# EasyEDA Pro project 最小系统板.eprj

# Schematic Schematic1
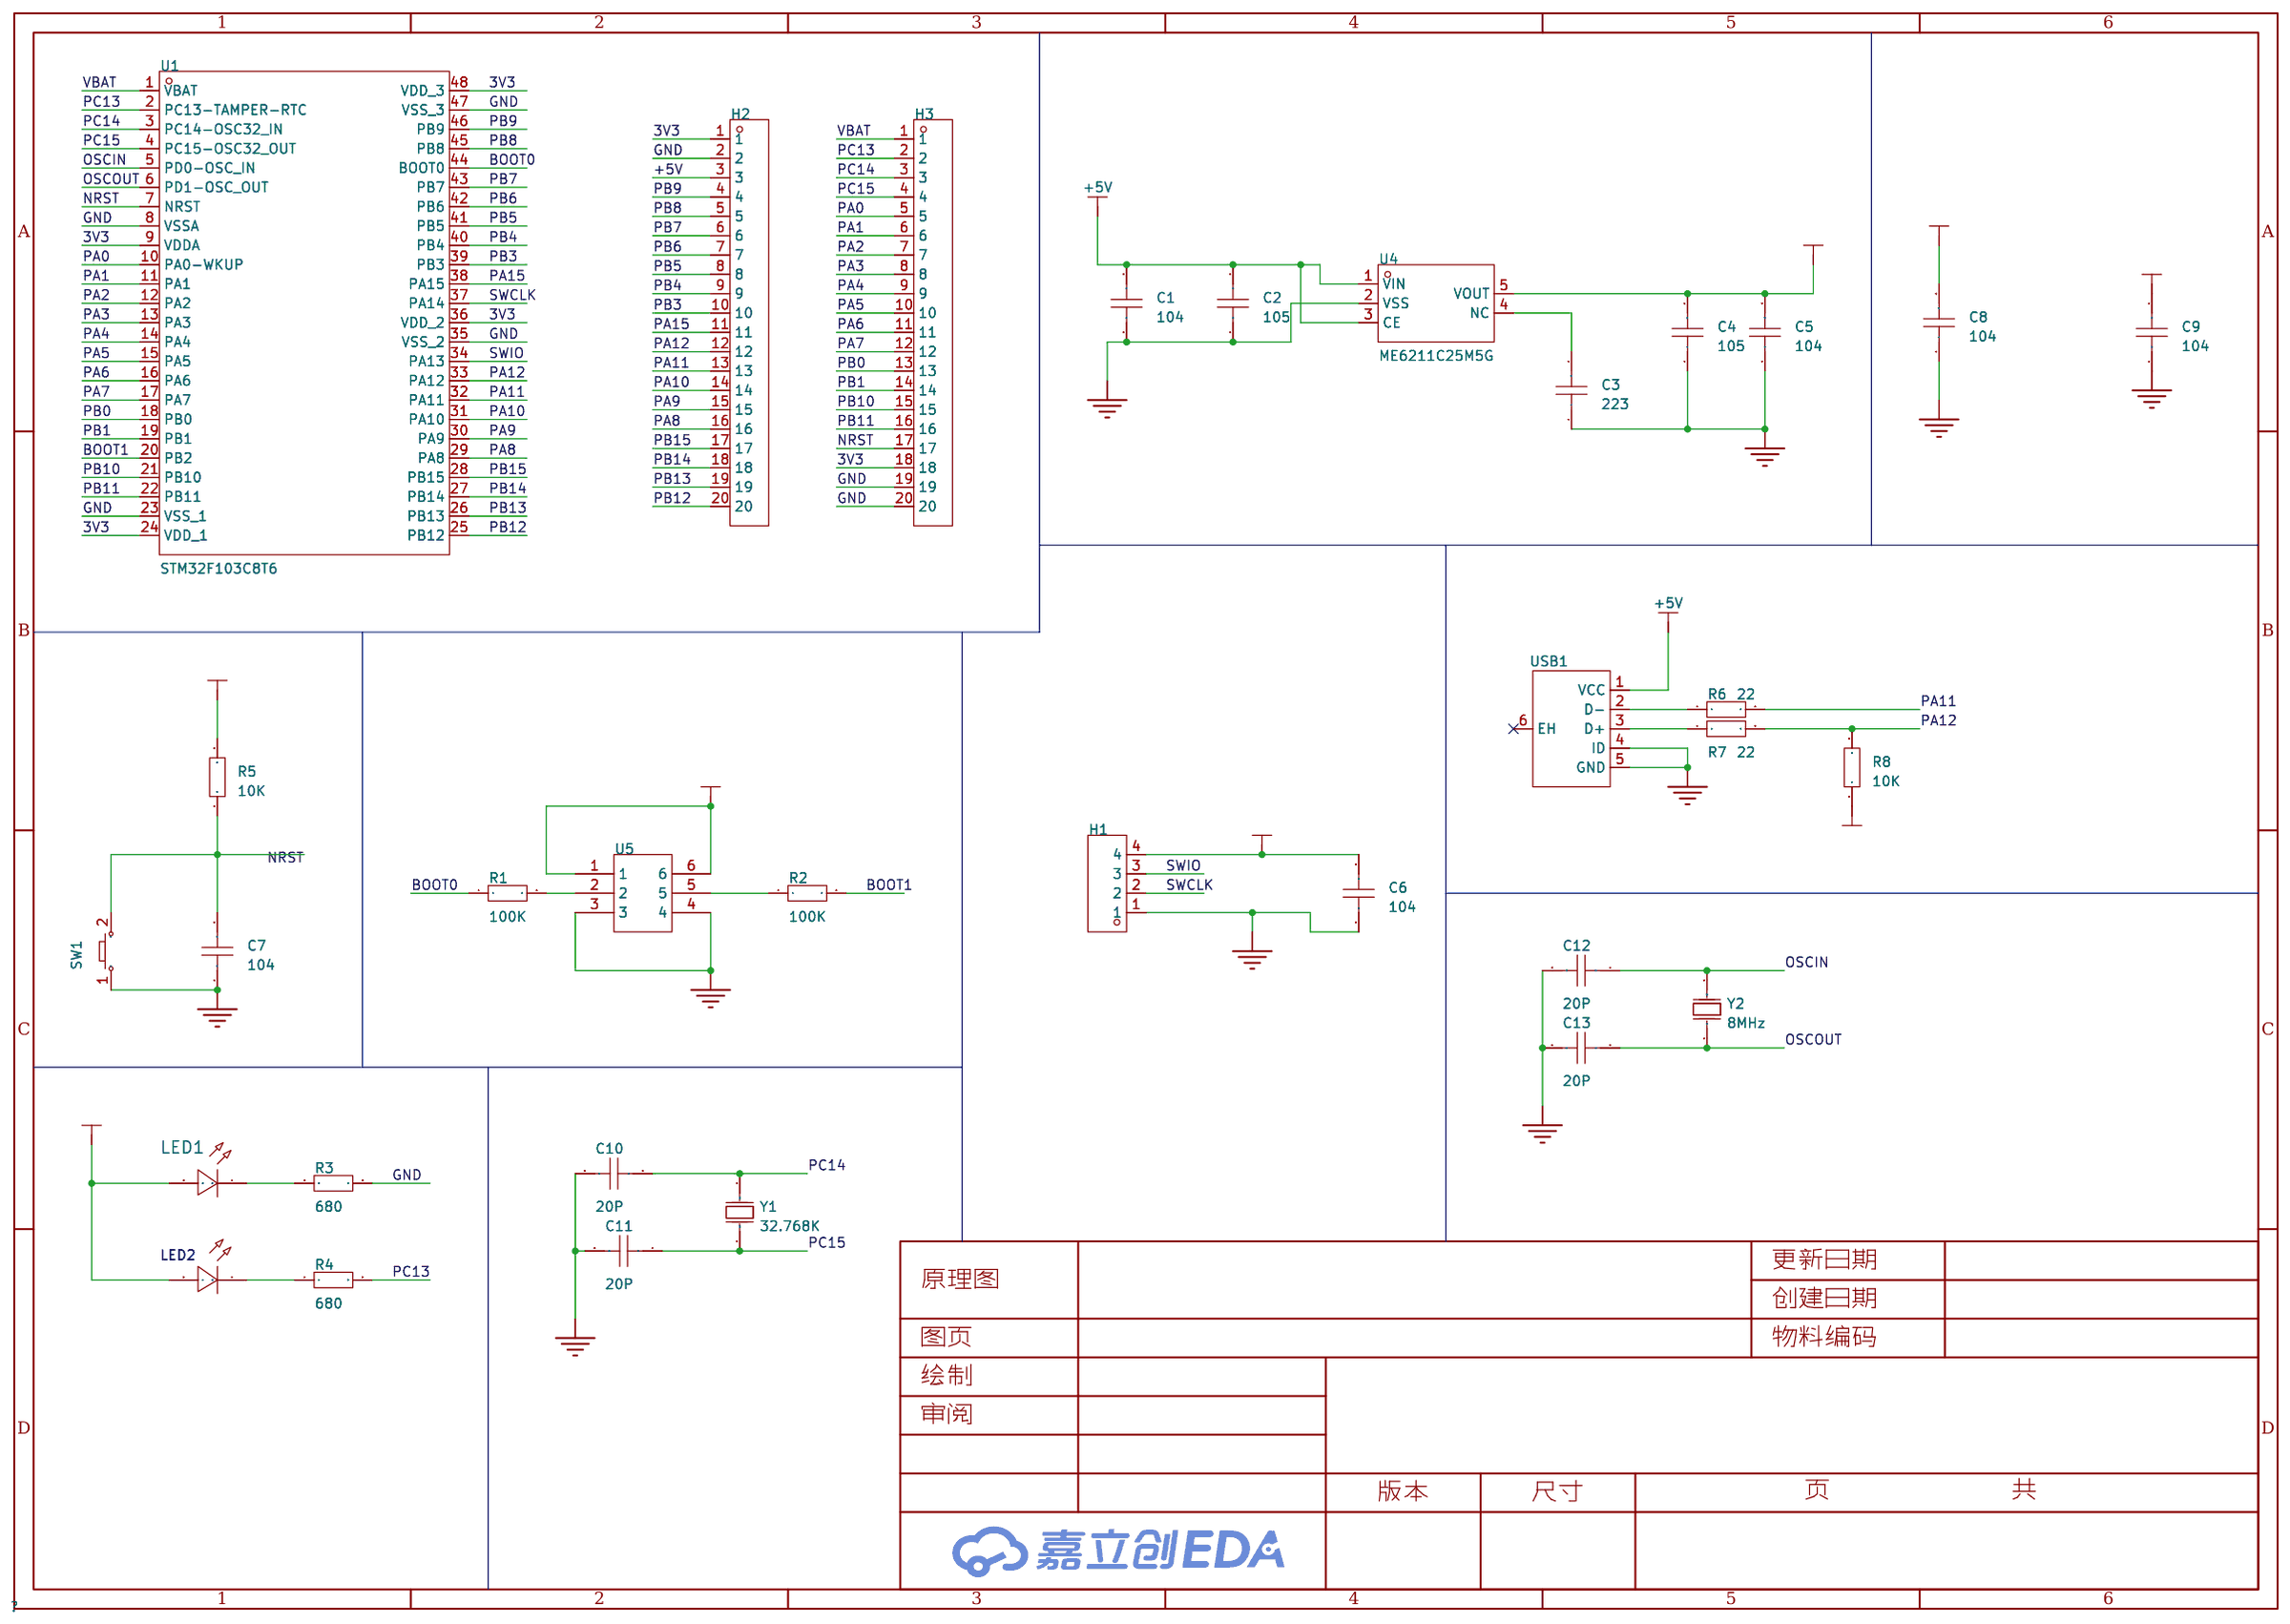
[diagram p0: schematic sheet]

## Parts
C1  104  [C0603]
C2  105  [C0603]
C3  223  [C0603]
C4  105  [C0603]
C5  104  [C0603]
C6  104  [C0603]
C7  104  [C0603]
C8  104  [C0603]
C9  104  [C0603]
C10  20P  [C0603]
C11  20P  [C0603]
C12  20P  [C0603]
C13  20P  [C0603]
H1  -  [HDR-TH_4P-P2.54-V-M]
H2  -  [HDR-TH_20P-P2.54-V-M-1]
H3  -  [HDR-TH_20P-P2.54-V-M-1]
LED1  -  [LED_0603]
LED2  -  [LED_0603]
R1  100K  [R0603]
R2  100K  [R0603]
R3  680  [R0603]
R4  680  [R0603]
R5  10K  [R0603]
R6  22  [R0603]
R7  22  [R0603]
R8  10K  [R0603]
SW1  -  [Key_SMD_3x4x2]
U1  STM32F103C8T6  [LQFP-48_L7.0-W7.0-P0.50-LS9.0-BL]
U4  ME6211C25M5G  [SOT-23-5_L2.9-W1.7-P0.95-LS2.8-BL]
U5  -  [排针2*3]
USB1  -  [USB_Micro]
Y1  32.768K  [OSC-SMD_L2.0-W1.2]
Y2  8MHz  [HC-49S_L11.4-W4.7-P4.88-D0.4]

## Library data of the parts
C1-C13 = CAP_0603: Supplier Footprint: 0603
H1 = HDR-M_2.54_1x4P: Supplier Part: C492403; Supplier Footprint: 插件
H2 H3 = HDR-M_2.54_1x20P: Supplier Part: C50981; Supplier Footprint: 插件
LED1 = LED_0603-R: Supplier Footprint: 0603
LED2 = LED_0603-B: Supplier Footprint: 0603
R1-R8 = Res_0603: Supplier Footprint: 0603
SW1 = Key_SMD_3x4x2: Supplier Footprint: SMD
U1 = STM32F103C8T6: LCSC Part Name: 主流增强型ARM Cortex-M3 MCU，具有64 KB Flash、72 MHz CPU、电机控制、USB和CAN; Supplier Part: C8734; Manufacturer: ST(意法半导体); Supplier Footprint: LQFP-48(7x7); JLCPCB Part Class: 扩展库; Datasheet: https://atta.szlcsc.com/upload/public/pdf/source/20220812/8363ACEC51AD55ECEB84799464F7CB85.pdf; Supplier: LCSC; CPU Core: ARM-M3; Program Storage Size: 64KB; RAM Size: 20KB; GPIO Ports Number: 37; Operating Voltage Range: 2V~3.6V; CPU Maximum Speed: 72MHz; Program Memory Type: FLASH; Operating Temperature Range: -40℃~+85℃; ADC (Bit): 12bit; Universal Serial Bus: 有; Peripheral/Function: 看门狗；DMA；看门狗；温度传感器; Watchdog: 有; Infrared Data Association: 有; Low-Voltage Detect: 有; Direct Memory Access: 有; Internal Oscillator: 有
U4 = ME6211C25M5G: LCSC Part Name: ME6211C25M5G 停产; Supplier Part: C2835813; Manufacturer: MICRONE(南京微盟); Supplier Footprint: SOT-23-5; JLCPCB Part Class: 扩展库; Datasheet: https://atta.szlcsc.com/upload/public/pdf/source/20211210/ACC7C3E9BA56F250BF966425916E32B9.pdf; Supplier: LCSC
U5 = 排针2*3
USB1 = USB_Micro-B: Supplier Footprint: SMD
Y1 = 32.768K: Supplier Part: C9900010122; Supplier Footprint: SMD2012-2P; JLCPCB Part Class: 扩展库; Supplier: LCSC
Y2 = ECS-080-20-4X-DU: LCSC Part Name: 8MHz ±30ppm 20pF; Supplier Part: C2636160; Manufacturer: ECS; Supplier Footprint: HC-49S; JLCPCB Part Class: 扩展库; Datasheet: https://atta.szlcsc.com/upload/public/pdf/source/20181031/C312311_8C746D9B0903A43D812CE762944D4B2E.pdf; Supplier: LCSC; Normal temperature Frequency Tolerance: ±30ppm; External load capacitor: 20pF; Frequency Stability(Full temperature range): ±100ppm; Equivalent Series Resistance (ESR): 80Ω; Operating Temperature: -55℃~+125℃

## Nets
3V3: C4.2 C5.2 C6.2 C8.2 C9.1 H1.4 H2.1 H3.18 LED1.2(A) LED2.2(A) R5.2 R8.1 U1.9(VDDA) U1.24(VDD_1) U1.36(VDD_2) U1.48(VDD_3) U4.5(VOUT) U5.1 U5.6
+5V: C1.2 C2.2 H2.3 U4.1(VIN) U4.3(CE) USB1.1(VCC)
GND: C1.1 C2.1 C3.1 C4.1 C5.1 C6.1 C7.1 C8.1 C9.2 C10.2 C11.2 C12.2 C13.2 H1.1 H2.2 H3.19 H3.20 R3.2 SW1.1 U1.8(VSSA) U1.23(VSS_1) U1.35(VSS_2) U1.47(VSS_3) U4.2(VSS) U5.3 U5.4 USB1.4(ID) USB1.5(GND)
VBAT: H3.1 U1.1(VBAT)
BOOT0: R1.1 U1.44(BOOT0)
BOOT1: R2.2 U1.20(PB2)
NRST: C7.2 H3.17 R5.1 SW1.2 U1.7(NRST)
OSCIN: C12.1 U1.5(PD0-OSC_IN) Y2.2
OSCOUT: C13.1 U1.6(PD1-OSC_OUT) Y2.1
PA0: H3.5 U1.10(PA0-WKUP)
PA1: H3.6 U1.11(PA1)
PA2: H3.7 U1.12(PA2)
PA3: H3.8 U1.13(PA3)
PA4: H3.9 U1.14(PA4)
PA5: H3.10 U1.15(PA5)
PA6: H3.11 U1.16(PA6)
PA7: H3.12 U1.17(PA7)
PA8: H2.16 U1.29(PA8)
PA9: H2.15 U1.30(PA9)
PA10: H2.14 U1.31(PA10)
PA11: H2.13 R6.2 U1.32(PA11)
PA12: H2.12 R7.2 R8.2 U1.33(PA12)
PA15: H2.11 U1.38(PA15)
PB0: H3.13 U1.18(PB0)
PB1: H3.14 U1.19(PB1)
PB3: H2.10 U1.39(PB3)
PB4: H2.9 U1.40(PB4)
PB5: H2.8 U1.41(PB5)
PB6: H2.7 U1.42(PB6)
PB7: H2.6 U1.43(PB7)
PB8: H2.5 U1.45(PB8)
PB9: H2.4 U1.46(PB9)
PB10: H3.15 U1.21(PB10)
PB11: H3.16 U1.22(PB11)
PB12: H2.20 U1.25(PB12)
PB13: H2.19 U1.26(PB13)
PB14: H2.18 U1.27(PB14)
PB15: H2.17 U1.28(PB15)
PC13: H3.2 R4.2 U1.2(PC13-TAMPER-RTC)
PC14: C10.1 H3.3 U1.3(PC14-OSC32_IN) Y1.2(OSC2)
PC15: C11.1 H3.4 U1.4(PC15-OSC32_OUT) Y1.1(OSC1)
SWCLK: H1.2 U1.37(PA14)
SWIO: H1.3 U1.34(PA13)
$1N8418: C3.2 U4.4(NC)
$1N9287: R1.2 U5.2
$1N9291: R2.1 U5.5
$1N9511: LED1.1(C) R3.1
$1N9515: LED2.1(C) R4.1
$1N10108: R6.1 USB1.2(D-)
$1N10112: R7.1 USB1.3(D+)

Not connected (* = marked no-connect by the designer): USB1 6(EH)*

# Board PCB3
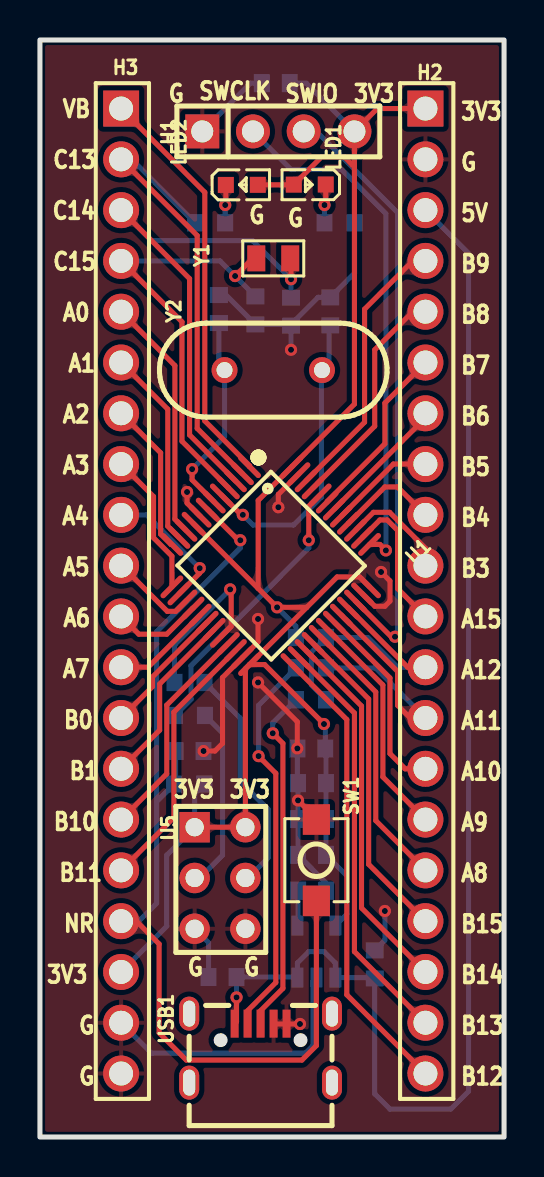
[diagram p1: board, top side]
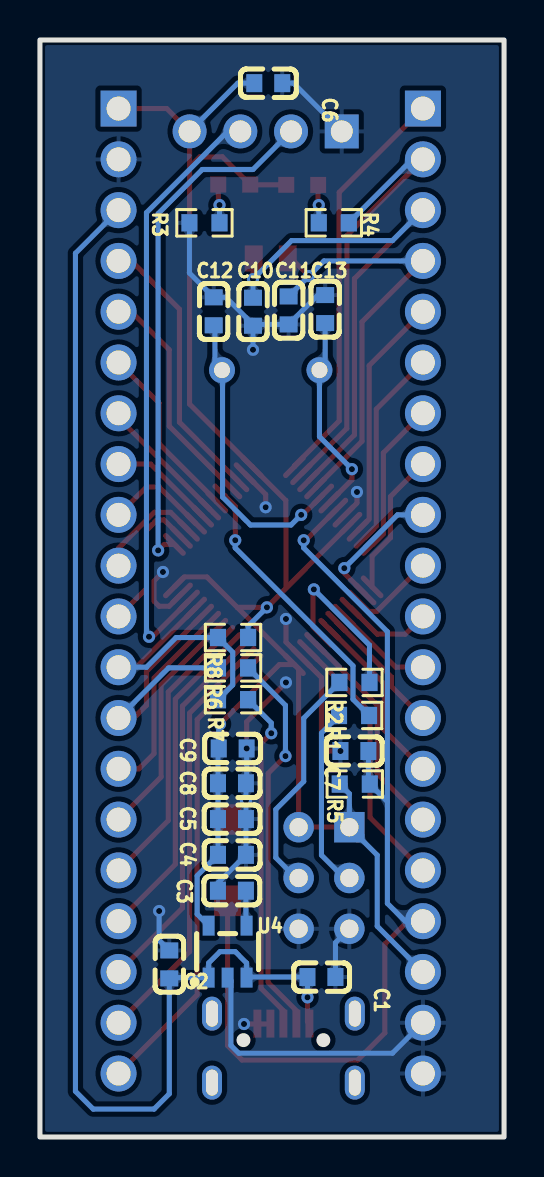
[diagram p2: board, bottom side, seen from below]

Outline 23.24 x 54.86 mm; copper layers: Top Layer, Bottom Layer. Coordinates in mm from the lower left corner of the outline.
Outline path: rectangle 0,54.86 23.24,0
Stack: Top Layer 0.035mm / Dielectric1 1.51mm FR4 er 4.5 / Bottom Layer 0.035mm

## Design rules (mm)
template: JLCPCB Capability(Two Layers Board)
spacing copperThickness1oz (default): track to track 0.102, other pairs 0.152 to 0.3
spacing copperThickness2oz: track to track 0.203, other pairs 0.152 to 0.3
track width copperThickness1oz (default): min 0.127, default 0.254, max 2.54
track width copperThickness2oz: min 0.203, default 0.254, max 2.54
differential pair differentialPair (default): width min 0.127, default 0.254, max 2.54; gap min 0.152, default 0.152
via viaSize (default): diameter min 0.5, default 0.61, max 10; hole min 0.3, default 0.305, max 6.3

## Placement (name value [footprint] x y rotation side)
C1  104  [C0603]  9.14 8 0 bottom
C2  105  [C0603]  16.76 8.63 270 bottom
C3  223  [C0603]  13.63 12.32 180 bottom
C4  105  [C0603]  13.62 14.11 0 bottom
C5  104  [C0603]  13.62 15.9 0 bottom
C6  104  [C0603]  11.81 52.71 0 bottom
C7  104  [C0603]  7.49 19.3 180 bottom
C8  104  [C0603]  13.62 17.69 0 bottom
C9  104  [C0603]  13.59 19.43 180 bottom
C10  20P  [C0603]  12.57 41.28 270 bottom
C11  20P  [C0603]  10.79 41.34 270 bottom
C12  20P  [C0603]  14.54 41.29 90 bottom
C13  20P  [C0603]  8.96 41.41 90 bottom
H1  -  [HDR-TH_4P-P2.54-V-M]  11.94 50.29 0 top
H2  -  [HDR-TH_20P-P2.54-V-M-1]  19.3 27.31 270 top
H3  -  [HDR-TH_20P-P2.54-V-M-1]  4.06 27.31 270 top
LED1  -  [LED_0603]  13.46 47.63 180 top
LED2  -  [LED_0603]  10.16 47.63 0 top
R1  100K  [R0603]  7.51 21.08 0 bottom
R2  100K  [R0603]  7.49 22.73 180 bottom
R3  680  [R0603]  15 45.72 0 bottom
R4  680  [R0603]  8.52 45.72 180 bottom
R5  10K  [R0603]  7.48 17.65 0 bottom
R6  22  [R0603]  13.57 23.46 0 bottom
R7  22  [R0603]  13.57 21.87 0 bottom
R8  10K  [R0603]  13.57 24.98 0 bottom
SW1  -  [Key_SMD_3x4x2]  13.84 13.84 270 top
U1  STM32F103C8T6  [LQFP-48_L7.0-W7.0-P0.50-LS9.0-BL]  11.56 28.58 225 top
U4  ME6211C25M5G  [SOT-23-5_L2.9-W1.7-P0.95-LS2.8-BL]  13.84 9.27 180 bottom
U5  -  [排针2*3]  -147.19 5.33 0 top
USB1  -  [USB_Micro]  11.05 4.45 0 top
Y1  32.768K  [OSC-SMD_L2.0-W1.2]  11.68 43.94 0 top
Y2  8MHz  [HC-49S_L11.4-W4.7-P4.88-D0.4]  11.68 38.35 0 top

## Footprints (pads in the part's own frame, mm; a bottom-side part is the same pattern mirrored in y, then rotated)
C0603
  rect 0.8x0.9 smd: 1(-0.7,0) 2(0.7,0)
HC-49S_L11.4-W4.7-P4.88-D0.4
  round 1.3 hole 0.8: 1(-2.44,0) 2(2.44,0)
HDR-TH_4P-P2.54-V-M
  rect 1.7x1.7 hole 1.1: 1(-3.81,0)
  round 1.7 hole 1.1: 2(-1.27,0) 3(1.27,0) 4(3.81,0)
HDR-TH_20P-P2.54-V-M-1
  rect 1.8x1.8 hole 1.2: 1(-24.13,0)
  round 1.8 hole 1.2: 2(-21.59,0) 3(-19.05,0) 4(-16.51,0) 5(-13.97,0) 6(-11.43,0) 7(-8.89,0) 8(-6.35,0) 9(-3.81,0) 10(-1.27,0) 11(1.27,0) 12(3.81,0) 13(6.35,0) 14(8.89,0) 15(11.43,0) 16(13.97,0) 17(16.51,0) 18(19.05,0) 19(21.59,0) 20(24.13,0)
Key_SMD_3x4x2
  rect 1.53x1.36 smd: 1(-2.035,0) 2(2.035,0)
LED_0603
  rect 0.8x0.8 smd: 1(-0.851,-0.01) 2(0.75,-0.005)
LQFP-48_L7.0-W7.0-P0.50-LS9.0-BL
  oval 0.27x1.5 smd: 1(-2.75,-4.25) 2(-2.25,-4.25) 3(-1.75,-4.25) 4(-1.25,-4.25) 5(-0.75,-4.25) 6(-0.25,-4.25) 7(0.25,-4.25) 8(0.75,-4.25) 9(1.25,-4.25) 10(1.75,-4.25) 11(2.25,-4.25) 12(2.75,-4.25) 25(2.75,4.25) 26(2.25,4.25) 27(1.75,4.25) 28(1.25,4.25) 29(0.75,4.25) 30(0.25,4.25) 31(-0.25,4.25) 32(-0.75,4.25) 33(-1.25,4.25) 34(-1.75,4.25) 35(-2.25,4.25) 36(-2.75,4.25)
  oval 1.5x0.27 smd: 13(4.25,-2.75) 14(4.25,-2.25) 15(4.25,-1.75) 16(4.25,-1.25) 17(4.25,-0.75) 18(4.25,-0.25) 19(4.25,0.25) 20(4.25,0.75) 21(4.25,1.25) 22(4.25,1.75) 23(4.25,2.25) 24(4.25,2.75) 37(-4.25,2.75) 38(-4.25,2.25) 39(-4.25,1.75) 40(-4.25,1.25) 41(-4.25,0.75) 42(-4.25,0.25) 43(-4.25,-0.25) 44(-4.25,-0.75) 45(-4.25,-1.25) 46(-4.25,-1.75) 47(-4.25,-2.25) 48(-4.25,-2.75)
OSC-SMD_L2.0-W1.2
  rect 0.9x1.3 smd: 1(-0.85,0) 2(0.85,0)
R0603
  rect 0.806x0.864 smd: 1(-0.753,0) 2(0.753,0)
SOT-23-5_L2.9-W1.7-P0.95-LS2.8-BL
  rect 0.6x1 smd: 1(-0.95,-1.3) 2(0,-1.3) 3(0.95,-1.3) 4(0.95,1.3) 5(-0.95,1.3)
USB_Micro
  rect 0.4x1.4 smd: 1(-1.3,1.225) 2(-0.65,1.225) 3(0,1.225) 4(0.65,1.225) 5(1.3,1.225)
  oval 1x1.7 hole 0.6x1.3: 6(-3.575,1.725) 6(-3.575,-1.725) 6(3.575,1.725) 6(3.575,-1.725)
排针2*3
  rect 1.524x1.524 hole 0.914: 1(154.94,10.16)
  round 1.524 hole 0.914: 2(154.94,7.62) 3(154.94,5.08) 4(157.48,5.08) 5(157.48,7.62) 6(157.48,10.16)

## Nets
As in the schematic.

Pads without a net: USB1 6

## Via types
v1: diameter 0.61, hole 0.305, Top Layer to Bottom Layer, 28 vias

## Routing (per net, layer and track width the routed paths; a pad name or vN(x,y) marks a point on that pad's centre or on a via; arc(x,y) is an arc through that point)
3V3: length 93.7
  Top Layer w0.254: 10.93,27.44 U1.9 ; 10.93,27.44 10.93,31.84 U1.48 15.75,36.66 15.75,48.61 ; 10.93,27.44 v1(11.88,26.49) 13.36,26.49 ; U1.24 10.29,23.42 10.29,15.49 7.75,15.49 ; U1.24 11.25,23.63 v1(14.22,20.65) ; U1.24 13.36,26.49 ; 15.75,48.61 H1.4 16.89,51.44 19.3,51.44 ; 15.75,48.61 15.65,48.61 15.24,49.02 14.1,49.02 LED1.2 12.7,47.62 LED2.2 ; 13.36,26.49 14.88,28.01 16.01,28.01 U1.36
  Bottom Layer w0.254: v1(14.22,20.65) 14.29,20.59 C9.1 14.32,19.4 C8.2 C5.2 C4.2 15.37,13.07 15.37,11.15 U4.5 ; H1.4 13.34,52.71 C6.2 ; R8.1 12.82,25.55 v1(11.88,26.49) ; H3.18 6.35,10.54 6.35,14.1 7.75,15.49 7.75,17.17 R5.2
+5V: length 67.4
  Top Layer w0.254: v1(9.84,6.99) 9.84,5.77 USB1.1
  Bottom Layer w0.254: 19.3,46.36 21.46,44.2 21.46,2.29 20.57,1.4 17.53,1.4 16.76,2.16 C2.2 16.73,7.97 U4.1 14.79,8.7 14.22,9.27 13.46,9.27 12.89,8.7 U4.3 12.86,8 C1.2 v1(9.84,6.99)
GND: length 64.5
  Top Layer w0.254: v1(13.02,5.65) 12.37,5.65 ; 12.37,5.65 12.35,5.67 ; 12.37,5.65 11.72,5.65 USB1.4 ; U1.47 11.94,32.14 v1(11.94,31.5) ; SW1.1 13.84,15.92 v1(12.92,16.83) ; v1(7.37,32.26) 7.37,31.71 U1.8 ; v1(8.19,19.3) 8.76,19.3 9.14,19.69 9.14,22.98 10.92,24.76 v1(10.92,25.91) ; v1(17.08,28.26) 17.53,27.81 17.53,26.8 17.27,26.54 16.77,26.54 16.15,27.16 ; v1(10.92,22.73) 12.89,20.77 v1(12.89,19.43)
  Bottom Layer w0.254: H1.1 10.54,52.71 C6.1 ; C10.2 v1(12.57,39.37) ; C10.2 12.51,40.64 C11.2 9.32,42.11 C13.2 ; C10.2 12.57,40.64 13.93,41.99 C12.2 15.76,43.21 R3.2 ; C1.1 8.44,9.72 7.75,10.41 ; U4.2 13.68,7.81 13.68,4.58 13.28,4.19 5.59,4.19 H3.19 ; C3.1 14.33,12.71 C4.1 C5.1 v1(12.92,16.83) C8.1 12.89,17.73 v1(12.89,19.43) ; C2.1 17.27,9.84 v1(17.27,11.3)
VBAT: length 20.6
  Top Layer w0.254: 4.06,51.44 8.25,47.24 8.25,35.81 10.5,33.57 U1.1
BOOT0: length 14
  Top Layer w0.254: v1(13.46,29.85) 13.46,31.54 U1.44
  Bottom Layer w0.254: v1(13.46,29.85) 13.46,29.46 7.56,23.57 7.56,21.89 R1.1
BOOT1: length 8.4
  Top Layer w0.254: U1.20 9.58,25.53 9.58,27.34 v1(9.53,27.39)
  Bottom Layer w0.254: v1(9.53,27.39) 6.74,24.6 R2.2
NRST: length 50.1
  Top Layer w0.254: 4.06,10.8 4.83,10.8 5.97,9.65 5.97,5.21 7.33,3.85 13.12,3.85 13.84,4.57 SW1.2 ; U1.7 9.93,29.85 v1(10.03,29.85)
  Bottom Layer w0.254: 5.84,16.77 5.84,25.27 10.03,29.46 v1(10.03,29.85) ; 5.84,16.77 R5.1 6.79,17.72 C7.2 ; 5.84,16.77 5.84,11.68 4.95,10.8 4.06,10.8
OSCIN: length 15
  Top Layer w0.254: U1.5 10.08,31.12 v1(10.16,31.12)
  Bottom Layer w0.254: v1(10.16,31.12) 10.67,30.61 12.7,30.61 14.1,32 14.1,38.33 Y2.2 14.48,38.71 14.48,40.53 C12.1
OSCOUT: length 10.2
  Top Layer w0.254: v1(7.62,33.4) 7.62,32.87 U1.6
  Bottom Layer w0.254: v1(7.62,33.4) 9.24,35.03 Y2.1 8.96,38.64 C13.1
PA0: length 12.3
  Top Layer w0.254: 4.06,41.28 6.76,38.58 6.76,30.9 U1.10
PA1: length 9.9
  Top Layer w0.254: H3.6 6.4,36.4 6.4,30.55 6.96,29.99
PA2: length 7.6
  Top Layer w0.254: H3.7 6.04,34.22 6.04,30.15 6.56,29.64 U1.12
PA3: length 7.2
  Top Layer w0.254: 4.06,33.66 5.69,32.03 5.69,29.97 6.61,29.05 U1.13
PA4: length 6.8
  Top Layer w0.254: v1(8,28.45) 8,28.2 U1.14
  Bottom Layer w0.254: H3.9 5.33,31.12 v1(8,28.45)
PA5: length 4.4
  Top Layer w0.254: U1.15 6.8,26.29 6.38,26.29 4.09,28.58 4.06,28.58
PA6: length 4.5
  Top Layer w0.254: U1.16 7.66,26.45 6.35,25.15 4.95,25.15 H3.11
PA7: length 5
  Top Layer w0.254: U1.17 5.42,23.5 4.06,23.5
PA8: length 13.9
  Top Layer w0.254: U1.29 16.82,22.26 16.82,15.82 H2.16
PA9: length 11.6
  Top Layer w0.254: 19.3,15.88 17.17,18.01 17.17,22.61 14.39,25.39
PA10: length 9.8
  Top Layer w0.254: 14.74,25.75 17.53,22.96 17.53,19.18 18.29,18.42 H2.14
PA11: length 13.4
  Top Layer w0.254: H2.13 18.54,20.96 17.91,21.59 17.91,23.29 U1.32
  Bottom Layer w0.254: H2.13 16.8,23.46 14.32,23.46
PA12: length 14.4
  Top Layer w0.254: U1.33 15.46,26.45 18.41,23.5 19.3,23.5
  Bottom Layer w0.254: 14.32,21.87 13.59,22.61 13.59,24.25 14.32,24.98 16.42,24.98 17.91,23.5 19.3,23.5
PA15: length 7.2
  Top Layer w0.254: H2.11 17.91,27.43 17.91,30.34 17.39,30.86 17.03,30.86 16.15,29.99
PB0: length 6.6
  Top Layer w0.254: U1.18 5.64,23.01 5.64,22.53 H3.13
PB1: length 8.9
  Top Layer w0.254: 8.73,25.39 5.99,22.66 5.99,20.35 H3.14
PB3: length 5.5
  Top Layer w0.254: U1.39 16.7,31.24 17.51,31.24 19.3,29.45 19.3,28.58
PB4: length 5.2
  Top Layer w0.254: U1.40 15.46,30.7 17.27,32.51 17.91,32.51 H2.9
PB5: length 5.3
  Top Layer w0.254: U1.41 17.7,33.66 19.3,33.66
PB6: length 6.7
  Top Layer w0.254: 14.74,31.4 19.3,35.97 H2.7
PB7: length 9
  Top Layer w0.254: U1.43 14.39,31.78 17.27,34.67 17.27,36.7 H2.6
PB8: length 11.5
  Top Layer w0.254: 19.3,41.28 18.67,41.28 16.76,39.37 16.76,35.55 U1.45
PB9: length 13.8
  Top Layer w0.254: U1.46 16.26,35.75 16.26,41.4 18.67,43.82 H2.4
PB10: length 11
  Top Layer w0.254: U1.21 6.35,21.6 6.35,18.16 4.06,15.88
PB11: length 13.4
  Top Layer w0.254: U1.22 6.71,21.25 6.71,15.98 H3.16
PB12: length 23.2
  Top Layer w0.254: H2.20 15.37,7.11 15.37,20.88 U1.25
PB13: length 20.9
  Top Layer w0.254: 12.97,23.98 15.75,21.2 15.75,9.27 H2.19
PB14: length 18.6
  Top Layer w0.254: H2.18 16.1,11.46 16.1,21.55 U1.27
PB15: length 16.2
  Top Layer w0.254: 19.3,10.8 16.46,13.64 16.46,21.9 U1.28
PC13: length 23.3
  Top Layer w0.254: H3.2 7.87,45.09 7.87,35.44 10.14,33.17
  Bottom Layer w0.254: R4.2 4.6,48.9 H3.2
PC14: length 27.7
  Top Layer w0.254: 4.06,46.36 7.49,42.93 7.49,35.11 U1.3 ; 12.57,42.93 12.57,43.9 Y1.2
  Bottom Layer w0.254: v1(12.57,42.9) 10.64,44.83 5.59,44.83 4.06,46.36 ; C10.1 12.57,42.8
PC15: length 22.5
  Top Layer w0.254: H3.4 7.11,40.77 7.11,34.8 9.44,32.47 U1.4 ; v1(9.77,43.06) 10.66,43.94 Y1.1
  Bottom Layer w0.254: C11.1 10.79,42.04 v1(9.77,43.06) 9.02,43.82 H3.4
SWCLK: length 26.1
  Top Layer w0.254: U1.37 17.02,29.64 v1(17.32,29.34)
  Bottom Layer w0.254: H1.2 12.57,48.39 15.11,48.39 17.32,46.18 v1(17.32,29.34)
SWIO: length 30.4
  Top Layer w0.254: v1(17.78,25.02) 17.59,25.02 U1.34
  Bottom Layer w0.254: H1.3 13.84,50.29 17.91,46.23 17.91,25.15 v1(17.78,25.02)
$1N8418: length 1.8
  Bottom Layer w0.254: C3.2 12.93,10.61 U4.4
$1N9287: length 9.2
  Bottom Layer w0.254: R1.2 9.14,20.2 9.14,14.1 8,12.95 7.75,12.95
$1N9291: length 11.6
  Bottom Layer w0.254: R2.1 10.03,20.95 10.03,17.78 11.43,16.38 11.43,13.97 10.41,12.95 10.29,12.95
$1N9511: length 1.9
  Top Layer w0.254: LED1.1 14.31,46.67 v1(14.25,46.61)
  Bottom Layer w0.254: R3.1 v1(14.25,46.61)
$1N9515: length 1.9
  Top Layer w0.254: v1(9.28,46.61) 9.31,46.64 LED2.1
  Bottom Layer w0.254: R4.1 v1(9.28,46.61)
$1N10108: length 19.5
  Top Layer w0.254: v1(10.95,19.05) 11.81,18.19 11.81,7.73 10.4,6.31 USB1.2
  Bottom Layer w0.254: R6.1 10.95,21.59 v1(10.95,19.05)
$1N10112: length 17.4
  Top Layer w0.254: v1(11.66,20.19) 12.17,19.68 12.17,7.43 11.05,6.31 USB1.3
  Bottom Layer w0.254: v1(11.66,20.19) 11.66,20.71 R7.1

## Copper pours and planes (outline as drawn; the poured copper is in the pictures)
GND on Top Layer: -5.08,58.29 29.21,58.29 29.21,-4.06 -5.08,-4.06
GND on Bottom Layer: -3.3,58.04 28.07,58.04 28.07,-3.43 -3.3,-3.43

Small or netless copper shapes (teardrops, artwork), in the pictures only: 92 on Top Layer, 110 on Bottom Layer

## Text on the board
Top Silkscreen Layer: 3V3 | C14 | C13 | C15 | B10 | B11 | A4 | VB | A0 | A2 | A3 | A5 | A7 | A6 | B0 | NR | A1 | B1 | G | SWCLK | SWIO | 5V | B9 | B8 | B7 | B6 | B5 | B4 | B3 | A15 | A12 | A11 | A10 | A9 | A8 | B15 | B14 | B13 | B12
